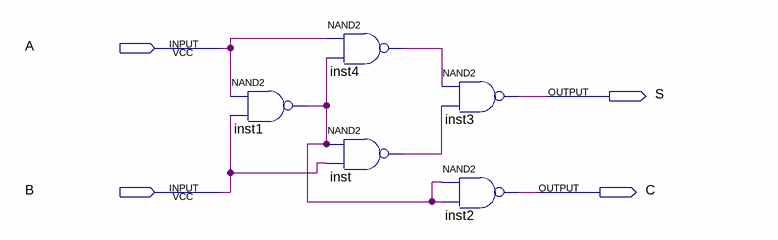
[diagram p0: schematic sheet]
// Quartus schematic ex1.bdf as structural Verilog: 5 symbols, 4 pins
module ex1 (
  input  A,
  input  B,
  output S,
  output C
);

  wire inst1_out, inst4_out, inst_out;

  nand inst1 (inst1_out, A, B);
  nand inst4 (inst4_out, A, inst1_out);
  nand inst (inst_out, inst1_out, B);
  nand inst3 (S, inst4_out, inst_out);
  nand inst2 (C, inst1_out, inst1_out);
endmodule
